# Altium project Baseboard-v2.0.PrjPcb (part 2 of 6)

## Sheet Power_Sheet.SchDoc
size A4; SheetNumber: 3; SheetTotal: 8
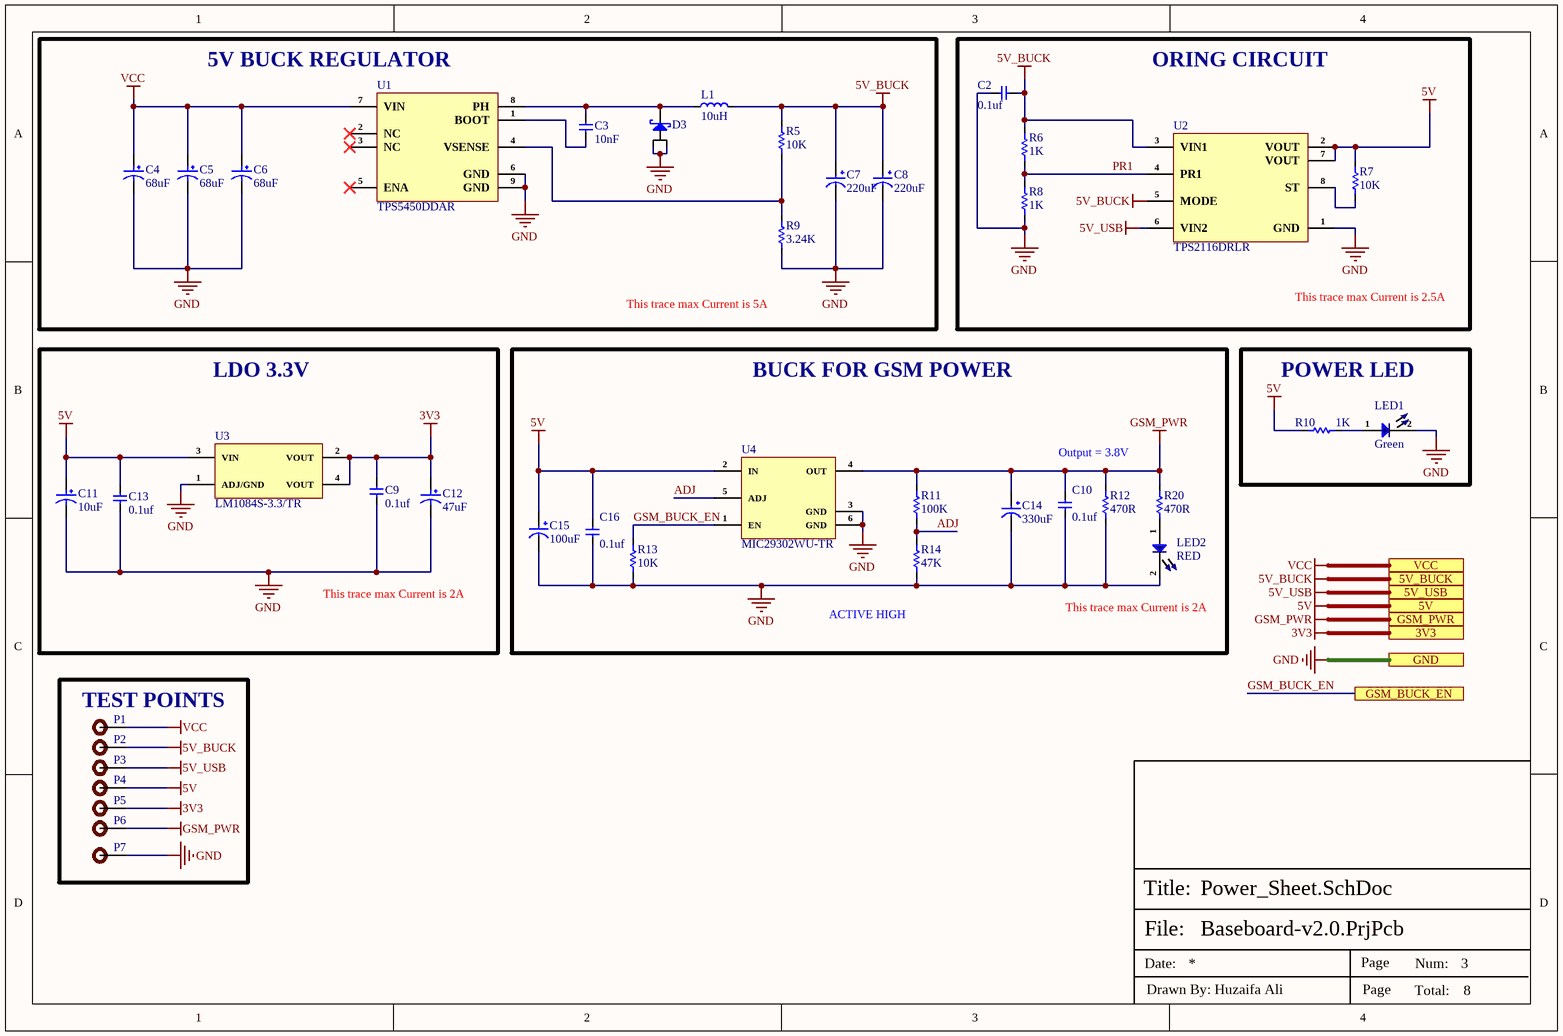
[diagram p2: Power_Sheet.SchDoc]

### Parts
C2  0.1uf  [Cap-0402]
C3  10nF  [Cap-0402]
C4  68uF  [RVT1H680M0607]
C5  68uF  [RVT1H680M0607]
C6  68uF  [RVT1H680M0607]
C7  220uF  [Case-D]
C8  220uF  [Case-D]
C9  0.1uf  [Cap-0402]
C10  0.1uf  [Cap-0402]
C11  10uF  [Case-A]
C12  47uF  [Case-A]
C13  0.1uf  [Cap-0402]
C14  330uF  [Case-E]
C15  100uF  [Case-B]
C16  0.1uf  [Cap-0402]
D3  ST20100L  [TO-277]  (value not drawn)
L1  10uH  [PSPMAA1040-100M-ANP]
LED1  Green  [LED-0402]
LED2  RED  [LED-0603]
P1  TEST POINT  [Test-point]  (value not drawn)
P2  TEST POINT  [Test-point]  (value not drawn)
P3  TEST POINT  [Test-point]  (value not drawn)
P4  TEST POINT  [Test-point]  (value not drawn)
P5  TEST POINT  [Test-point]  (value not drawn)
P6  TEST POINT  [Test-point]  (value not drawn)
P7  TEST POINT  [Test-point]  (value not drawn)
R5  10K  [Res-0201]
R6  1K  [Res-0201]
R7  10K  [Res-0201]
R8  1K  [Res-0201]
R9  3.24K  [Res-0603]
R10  1K  [Res-0201]
R11  100K  [Res-0201]
R12  470R  [Res-0201]
R13  10K  [Res-0201]
R14  47K  [Res-0402]
R20  470R  [Res-0201]
U1  TPS5450DDAR  [8-SO-EP_]
U2  TPS2116DRLR  [SOT-583]
U3  LM1084S-3.3/TR  [TO263-3_]
U4  MIC29302WU-TR  [TO-263-5 (D2PAK)]

### Blocks framed on the sheet
5V BUCK REGULATOR: C3-C8 D3 L1 R5 R9 U1
ORING CIRCUIT: C2 R6-R8 U2
LDO 3.3V: C9 C11-C13 U3
BUCK FOR GSM POWER: C10 C14-C16 LED2 R11-R14 R20 U4
POWER LED: LED1 R10
TEST POINTS: P1-P7

### Ports
3V3, 5V, 5V_BUCK, 5V_USB, GND, GSM_BUCK_EN, GSM_PWR, VCC

### Nets
3V3: C9.2 C12.1 P5.1 U3.2(VOUT) U3.4(VOUT) ; port 3V3
5V: C11.1 C13.2 C15.1 C16.2 P4.1 R7.1 R10.2 U2.2(VOUT) U2.7(VOUT) U3.3(VIN) U4.2(IN) ; port 5V
5V_BUCK: C2.2 C7.1 C8.1 L1.2 P2.1 R5.2 R6.2 U2.3(VIN1) U2.5(MODE) ; port 5V_BUCK
5V_USB: P3.1 U2.6(VIN2) ; port 5V_USB
GND: C2.1 C4.2 C5.2 C6.2 C7.2 C8.2 C9.1 C10.1 C11.2 C12.2 C13.1 C14.2 C15.2 C16.1 D3.1(A1) D3.3(A2) LED1.2 LED2.2 P7.1 R8.1 R9.1 R12.1 R13.1 R14.1 U1.6(GND) U1.9(GND) U2.1(GND) U3.1(ADJ/GND) U4.3(GND) U4.6(GND) ; port GND
GSM_PWR: C10.2 C14.1 P6.1 R11.2 R12.2 R20.2 U4.4(OUT) ; port GSM_PWR
VCC: C4.1 C5.1 C6.1 P1.1 U1.7(VIN) ; port VCC
ADJ: R11.1 R14.2 U4.5(ADJ)
GSM_BUCK_EN: R13.2 U4.1(EN) ; port GSM_BUCK_EN
PR1: R6.1 R8.2 U2.4(PR1)
NetC3_1: C3.1 U1.1(BOOT)
NetC3_2: C3.2 D3.2(K) L1.1 U1.8(PH)
NetLED1_1: LED1.1 R10.1
NetLED2_1: LED2.1 R20.1
NetR5_1: R5.1 R9.2 U1.4(VSENSE)
NetR7_2: R7.2 U2.8(ST)

Not connected (* = marked no-connect by the designer): U1 2(NC)* 3(NC)* 5(ENA)*

### Notes on the sheet
- (near R9) This trace max Current is 5A
- This trace max Current is 2.5A
- Output = 3.8V
- This trace max Current is 2A
- (near R14) ACTIVE HIGH
- (near LED2) This trace max Current is 2A
- File:
- Title:
- Date:
- Page
- Num:
- Total:
- Drawn By: Huzaifa Ali

### Library data of the parts
C2 C9 C10 C13 C16 = GRM155R62A104KE14D: CAP CER 0.1UF 100V X5R 0402; Manufacturer: Murata; Capacitance: 100nF; Tolerance: 10%; Item Type: Capacitor; Supplier 1: Arrow Electronics; Manufacturer Part Number: GRM155R62A104KE14D; RoHS: Yes; Category: Ceramic Capacitors; Stock 1: 870000; Pricing 1: 10000=0.00500, 20000=0.00410, 30000=0.00390, 50000=0.00370, 100000=0.00300 (USD); Mount: Surface Mount; Case/Package: 0402; Case Code (Metric): 1005; Case Code (Imperial): 0402; Weight: 0.000212oz; Min Operating Temperature: -55°C; Max Operating Temperature: 85°C; Packaging: Tape and Reel; Voltage Rating: 100V; Dielectric: X5R; Termination: SMD/SMT; Voltage Rating (DC): 100V; Package Quantity: 10000; Series: GRM; Length: 0.039inch; Width: 0.02inch; Height: 0.5mm; Thickness: 0.022inch; Reach SVHC Compliant: Yes; Lead Free: Lead Free; RoHS Compliant: Yes; ComponentLink1URL: http://www.farnell.com/datasheets/2079151.pdf?src-supplier=Farnell; ComponentLink1Description: http://www.farnell.com/datasheets/2079151.pdf?src-supplier=Farnell; ComponentLink2URL: http://www.mouser.com/ds/2/281/c02e-2905.pdf?src-supplier=Mouser; ComponentLink2Description: http://www.mouser.com/ds/2/281/c02e-2905.pdf?src-supplier=Mouser; ComponentLink3URL: http://www.farnell.com/datasheets/2079151.pdf?src-supplier=Element14; ComponentLink3Description: http://www.farnell.com/datasheets/2079151.pdf?src-supplier=Element14; ComponentLink4URL: http://search.murata.co.jp/Ceramy/image/img/A01X/G101/ENG/GRM155R62A104KE14-01.pdf?src-supplier=Digi-Key; ComponentLink4Description: http://search.murata.co.jp/Ceramy/image/img/A01X/G101/ENG/GRM155R62A104KE14-01.pdf?src-supplier=Digi-Key; ComponentLink5URL: http://www.farnell.com/datasheets/2079151.pdf?src-supplier=Newark; ComponentLink5Description: http://www.farnell.com/datasheets/2079151.pdf?src-supplier=Newark; Supplier Part Number 1: GRM155R62A104KE14D; LCSC Part Number: C162178
C3 = CC0402KRX7R9BB103: CAP CER 10000PF 50V X7R 0402; Manufacturer: Yageo; Tolerance: 10%; Item Type: Capacitor; Supplier 1: Avnet; Manufacturer Part Number: CC0402KRX7R9BB103; RoHS: Yes; Category: Ceramic Capacitors; Stock 1: 995000; Pricing 1: 10000=0.00178 (USD); Mount: Surface Mount; Case/Package: 0402; Case Code (Imperial): 0402; Case Code (Metric): 1005; Min Operating Temperature: -55°C; Max Operating Temperature: 125°C; Capacitance: 10nF; Dielectric: X7R; Packaging: Tape and Reel; Voltage Rating: 50V; Voltage Rating (DC): 50V; Package Quantity: 1; Termination: SMD/SMT; Resistor Type: Ceramic; Voltage: 50V; Series: CC; Length: 1mm; Width: 0.02inch; Height: 0.5mm; Thickness: 0.022inch; Depth: 0.5mm; Radiation Hardening: No; RoHS Compliant: Yes; Reach SVHC Compliant: Yes; Lead Free: Lead Free; Halogen Free: Halogen Free; ComponentLink1URL: https://datasheet.ciiva.com/11788/0900766b8079c870-11788375.pdf?src-supplier=RSComponents; ComponentLink1Description: https://datasheet.ciiva.com/11788/0900766b8079c870-11788375.pdf?src-supplier=RSComponents; ComponentLink2URL: https://datasheet.ciiva.com/26862/getdatasheetpartid-138248-26862642.pdf?src-supplier=Verical; ComponentLink2Description: https://datasheet.ciiva.com/26862/getdatasheetpartid-138248-26862642.pdf?src-supplier=Verical; ComponentLink3URL: https://datasheet.ciiva.com/7978/1489800-7978093.pdf?src-supplier=Element14; ComponentLink3Description: https://datasheet.ciiva.com/7978/1489800-7978093.pdf?src-supplier=Element14; ComponentLink4URL: https://datasheet.ciiva.com/28450/1489800-28450377.pdf?src-supplier=Element14; ComponentLink4Description: https://datasheet.ciiva.com/28450/1489800-28450377.pdf?src-supplier=Element14; ComponentLink5URL: https://datasheet.ciiva.com/176/mlccorderingcode-176349.pdf?src-supplier=Digi-Key; ComponentLink5Description: https://datasheet.ciiva.com/176/mlccorderingcode-176349.pdf?src-supplier=Digi-Key; ComponentLink6URL: https://datasheet.ciiva.com/176/mlccorderingcode-176348.pdf?src-supplier=Digi-Key; ComponentLink6Description: https://datasheet.ciiva.com/176/mlccorderingcode-176348.pdf?src-supplier=Digi-Key; ComponentLink7URL: https://datasheet.ciiva.com/176/mlccorderingcode-176350.pdf?src-supplier=Digi-Key; ComponentLink7Description: https://datasheet.ciiva.com/176/mlccorderingcode-176350.pdf?src-supplier=Digi-Key; Supplier Part Number 1: CC0402KRX7R9BB103; LCSC Part Number: C60133
C4-C6 = RVT1H680M0607: 68uF 50V SMD,D6.3xL7.7mm Aluminum Electrolytic Capacitors - SMD ROHS; Manufacturer: ROQANG; Manufacturer Part Number: RVT1H680M0607; Package: SMD,D6.3xL7.7mm; LCSC Part Number: C5221836; Item Type: Capacitor; ComponentLink1Description: LCSC; ComponentLink1URL: https://www.lcsc.com/product-detail/Aluminum-Electrolytic-Capacitors-SMD_ROQANG-RVT1H680M0607_C5221836.html
C7 C8 = TAJD227K010RNJ: CAP TANT 220UF 10% 10V 2917; Manufacturer: Kyocera AVX; Item Type: Capacitor; Supplier: Rs; Supplier Part Number: 1349925; Manufacturer Part Number: TAJD227K010RNJ; RoHS: Yes; Category: Tantalum Capacitors; Stock: 100; Pricing: 500=0.553, 2500=0.537, 5000=0.523 (GBP); ComponentLink1URL: https://datasheet.ciiva.com/11793/0900766b80ccdc61-11793083.pdf?src-supplier=Rs; ComponentLink1Description: https://datasheet.ciiva.com/11793/0900766b80ccdc61-11793083.pdf?src-supplier=Rs; ComponentLink2URL: https://datasheet.ciiva.com/3004/taj-3004530.pdf?src-supplier=Avnet; ComponentLink2Description: https://datasheet.ciiva.com/3004/taj-3004530.pdf?src-supplier=Avnet; ComponentLink3URL: https://datasheet.ciiva.com/3004/taj-3004531.pdf?src-supplier=Avnet; ComponentLink3Description: https://datasheet.ciiva.com/3004/taj-3004531.pdf?src-supplier=Avnet; ComponentLink4URL: https://datasheet.ciiva.com/264/taj-264391.pdf?src-supplier=Digi-Key; ComponentLink4Description: https://datasheet.ciiva.com/264/taj-264391.pdf?src-supplier=Digi-Key; ComponentLink5URL: https://datasheet.ciiva.com/264/taj-264392.pdf?src-supplier=Digi-Key; ComponentLink5Description: https://datasheet.ciiva.com/264/taj-264392.pdf?src-supplier=Digi-Key; ComponentLink6URL: https://datasheet.ciiva.com/264/taj-264393.pdf?src-supplier=Digi-Key; ComponentLink6Description: https://datasheet.ciiva.com/264/taj-264393.pdf?src-supplier=Digi-Key; ComponentLink7URL: https://datasheet.ciiva.com/15163/getdatasheetpartid-121064-15163429.pdf?src-supplier=Verical; ComponentLink7Description: https://datasheet.ciiva.com/15163/getdatasheetpartid-121064-15163429.pdf?src-supplier=Verical; ComponentLink8URL: https://datasheet.ciiva.com/16201/taj-16201535.pdf?src-supplier=Future+Electronics; ComponentLink8Description: https://datasheet.ciiva.com/16201/taj-16201535.pdf?src-supplier=Future+Electronics; LCSC Part Number: C8024
C11 = CA45-A-10V-10uF-K: 10uF 10V 8Ω@100kHz ±10% CASE-A-3216 Tantalum Capacitors ROHS; Manufacturer: CEC(Shenzhen Zhenhua XinYun Elec); Manufacturer Part Number: CA45-A-10V-10uF-K; Package: CASE-A-3216; LCSC Part Number: C128253; Item Type: Capacitor; ComponentLink1Description: LCSC; ComponentLink1URL: https://www.lcsc.com/product-detail/Tantalum-Capacitors_CEC-Shenzhen-Zhenhua-XinYun-Elec-CA45-A-10V-10uF-K_C128253.html
C12 = CA45-A-6.3V-47uF-K: 47uF 6.3V 5Ω@100kHz ±10% CASE-A-3216 Tantalum Capacitors ROHS; Manufacturer: CEC; Manufacturer Part Number: CA45-A-6.3V-47uF-K; Package: CASE-A-3216; ComponentLink1Description: LCSC; ComponentLink1URL: https://www.lcsc.com/product-detail/Tantalum-Capacitors_CEC-Shenzhen-Zhenhua-XinYun-Elec-CA45-A-6-3V-47uF-K_C129570.html; LCSC Part Number: C129570; Item Type: Capacitor
C14 = TAJE337M016RNJ: CAP TANT 330UF 20% 16V 2917; Manufacturer: Kyocera AVX; ESR (Equivalent Series Resistance): 400mR; Leakage Current: 52.8uA; Dissipation Factor: 30%; Item Type: Capacitor; Supplier 1: Arrow Electronics; Manufacturer Part Number: TAJE337M016RNJ; RoHS: Yes; Category: Tantalum Capacitors; Stock 1: 4000; Pricing 1: 400=1.8678, 2000=1.7998, 4000=1.7657, 6000=1.7481, 10000=1.7306, 30000=1.7133, 50000=1.6961 (USD); Mounting Technology: Surface Mount; Case/Package: 2917; Case Code (Imperial): 2917; Case Code (Metric): 7343; Min Operating Temperature: -55°C; Max Operating Temperature: 125°C; Voltage Rating: 16V; Tolerance: 20%; Packaging: Tape and Reel; Value: 330uF; Termination: SMD/SMT; Voltage Rating (DC): 16V; Series: TAJ; Features: General Purpose; Length: 7.3mm; Width: 4.3mm; Height: 4.3mm; Lead Free: Lead Free; RoHS Compliant: Yes; ComponentLink1URL: https://datasheet.ciiva.com/12882/taj-27497-12882412.pdf?src-supplier=Mouser; ComponentLink1Description: https://datasheet.ciiva.com/12882/taj-27497-12882412.pdf?src-supplier=Mouser; Supplier Part Number 1: TAJE337M016RNJ; LCSC Part Number: C51599
C15 = TAJB107M010RNJ: CAP TANT 100UF 20% 10V 1411; Manufacturer: Kyocera AVX; Dielectric Material: Tantalum; Tolerance: 10%; ESR (Equivalent Series Resistance): 1.4R; Leakage Current: 10uA; Dissipation Factor: 8%; Item Type: Capacitor; Supplier 1: Rs; Manufacturer Part Number: TAJB107M010RNJ; RoHS: Yes; Category: Tantalum Capacitors; Stock 1: 17520; Pricing 1: 2000=0.302 (GBP); Mounting Technology: Surface Mount; Case/Package: 1210; Case Code (Imperial): 1210; Case Code (Metric): 3528; Min Operating Temperature: -55°C; Max Operating Temperature: 125°C; Value: 100uF; Voltage Rating (DC): 10V; Series: TAJ; Construction: Flat; Voltage Rating: 10V; Package Quantity: 2000; Packaging: Tape and Reel; Termination: SMD/SMT; Voltage: 10V; Features: General Purpose; Length: 3.5mm; Width: 2.8mm; Height: 2.1mm; Depth: 2.8mm; Radiation Hardening: No; Lead Free: Lead Free; RoHS Compliant: Yes; Reach SVHC Compliant: No; ComponentLink1URL: https://datasheet.ciiva.com/264/taj-264281.pdf?src-supplier=Digi-Key; ComponentLink1Description: https://datasheet.ciiva.com/264/taj-264281.pdf?src-supplier=Digi-Key; ComponentLink2URL: https://datasheet.ciiva.com/264/taj-264280.pdf?src-supplier=Digi-Key; ComponentLink2Description: https://datasheet.ciiva.com/264/taj-264280.pdf?src-supplier=Digi-Key; ComponentLink3URL: https://datasheet.ciiva.com/264/taj-264282.pdf?src-supplier=Digi-Key; ComponentLink3Description: https://datasheet.ciiva.com/264/taj-264282.pdf?src-supplier=Digi-Key; ComponentLink4URL: https://datasheet.ciiva.com/11225/taj-11225964.pdf?src-supplier=Avnet; ComponentLink4Description: https://datasheet.ciiva.com/11225/taj-11225964.pdf?src-supplier=Avnet; ComponentLink5URL: https://datasheet.ciiva.com/11225/taj-11225963.pdf?src-supplier=Avnet; ComponentLink5Description: https://datasheet.ciiva.com/11225/taj-11225963.pdf?src-supplier=Avnet; Supplier Part Number 1: 1354069; LCSC Part Number: C7196
D3 = ST20100L: 100V Single 650mV@20A 20A TO-277 Schottky Barrier Diodes (SBD) ROHS; Manufacturer: Jiangsu Changjing Electronics Technology Co., Ltd.; Item Type: Diode; Manufacturer Part Number: ST20100L; Package: TO-277; LCSC Part Number: C2693410; ComponentLink1Description: LCSC; ComponentLink1URL: https://www.lcsc.com/product-detail/Schottky-Barrier-Diodes-SBD_Jiangsu-Changjing-Electronics-Technology-Co-Ltd-ST20100L_C2693410.html
L1 = PSPMAA1040-100M-ANP: 7A 10uH ±20% 10A SMD,10.3x10.5mm Power Inductors ROHS; Manufacturer: PROD Tech; Manufacturer Part Number: PSPMAA1040-100M-ANP; Package: SMD,10.3x10.5mm; LCSC Part Number: C2983105; Item Type: Inductor; ComponentLink1Description: LCSC; ComponentLink1URL: https://www.lcsc.com/product-detail/Power-Inductors_PROD-Tech-PSPMAA1040-100M-ANP_C2983105.html
LED1 = 16-213/GHC-YR1S1/3T: Green 520~535nm 0402 Light Emitting Diodes (LED) RoHS; Manufacturer: Everlight Elec; Luminous Intensity (IF=20mA): 112~285mcd; Package: 0402; Illumination Color: Green; Dominant Wavelength / Coordinate rank: 520~535nm; Mounting Type: Surface Mount; Manufacturer Part Number: 16-213/GHC-YR1S1/3T; ComponentLink1Description: LCSC; ComponentLink1URL: https://www.lcsc.com/product-detail/Light-Emitting-Diodes-LED_Everlight-Elec-16-213-GHC-YR1S1-3T_C74338.html; LCSC Part Number: C74338; Item Type: LED
LED2 = 19-21/R7C-AK1L2BY/3T: Red 632nm LED Indication - Discrete 2.05V 0603 (1608 Metric); Manufacturer: Everlight Elec; Manufacturer Part Number: 19-21/R7C-AK1L2BY/3T; Package: 0603; LCSC Part Number: C1322287; Item Type: LED; ComponentLink1Description: LCSC; ComponentLink1URL: https://www.lcsc.com/product-detail/Light-Emitting-Diodes-LED_Everlight-Elec-19-21-R7C-AK1L2BY-3T_C1322287.html
P1-P7 = TEST POINT: Test Point ON
R5 R7 R13 = RC0201FR-0710KL: RES SMD 10K OHM 1% 1/20W 0201; Manufacturer: Yageo; Item Type: Resistor; Manufacturer Part Number: RC0201FR-0710KL; Package: 0201; ComponentLink7Description: LCSC; ComponentLink7URL: https://www.lcsc.com/product-detail/Chip-Resistor-Surface-Mount_YAGEO-RC0201FR-0710KL_C106225.html; LCSC Part Number: C106225
R6 R8 R10 = RC0201FR-071KP: RES 1K OHM 1% 1/20W 0201; Manufacturer: Yageo; Supplier 1: Digi-Key; Manufacturer Part Number: RC0201FR-071KP; RoHS: Yes; Stock 1: 4800; Pricing 1: 1=0.11000, 10=0.10200, 100=0.03940, 1000=0.01734, 2500=0.01497, 5000=0.01340 (USD); RoHS Compliant: Yes; Supplier Part Number 1: 13-RC0201FR-071KPCT-ND; LCSC Part Number: C3953443
R9 = 0603WAF3241T5E: 100mW Thick Film Resistors ±1% 3.24kΩ 0603 Chip Resistor - Surface Mount ROHS; Manufacturer: UNI-ROYAL; Manufacturer Part Number: 0603WAF3241T5E; Package: 0603; LCSC Part Number: C22994; Item Type: Resistor; ComponentLink1Description: LCSC; ComponentLink1URL: https://www.lcsc.com/product-detail/Chip-Resistor-Surface-Mount_UNI-ROYAL-Uniroyal-Elec-0603WAF3241T5E_C22994.html
R11 = RC0201JR-07100KL: RES SMD 100K OHM 5% 1/20W 0201; Manufacturer: Yageo; Resistance: 100kR; Temperature Coefficient: 200ppm/°C; Power Rating: 50mW; Voltage Rating: 25V; Supplier 1: Arrow Electronics; Manufacturer Part Number: RC0201JR-07100KL; RoHS: Yes; Category: Chip SMD Resistors; Stock 1: 76; Pricing 1: 1=0.09240, 10=0.09140, 25=0.05450, 10000=0.00340, 100000=0.00320, 1000000=0.00180, 5000000=0.00110 (USD); Case/Package: 0201; Contact Plating: Tin,Matte; Case Code (Metric): 0603; Case Code (Imperial): 0201; Weight: 6E-06oz; Size Code: 0201; Min Operating Temperature: -55°C; Max Operating Temperature: 125°C; Tolerance: 5%; Resistor Type: Thick Film; Package Quantity: 1; Packaging: Tape and Reel; Number of Terminations: 2; Termination: SMD/SMT; Max Power Dissipation: 50mW; Voltage Rating (DC): 25V; Features: Moisture Resistant; Series: RC; Resistance Tolerance: 5%; Construction: Rectangular; Length: 0.6mm; Width: 0.012inch; Height: 0.01inch; Depth: 0.3mm; Radiation Hardening: No; REACH SVHC: No SVHC; Military Standard: Not; Lead Free: Lead Free; RoHS Compliant: Yes; ComponentLink1URL: https://datasheet.ciiva.com/2462/pyu-r-int-thick-7-2462817.pdf?src-supplier=Digi-Key; ComponentLink1Description: https://datasheet.ciiva.com/2462/pyu-r-int-thick-7-2462817.pdf?src-supplier=Digi-Key; ComponentLink2URL: https://datasheet.ciiva.com/2462/pyu-r-int-thick-7-2462818.pdf?src-supplier=Digi-Key; ComponentLink2Description: https://datasheet.ciiva.com/2462/pyu-r-int-thick-7-2462818.pdf?src-supplier=Digi-Key; ComponentLink3URL: https://datasheet.ciiva.com/2462/pyu-r-int-thick-7-2462819.pdf?src-supplier=Digi-Key; ComponentLink3Description: https://datasheet.ciiva.com/2462/pyu-r-int-thick-7-2462819.pdf?src-supplier=Digi-Key; ComponentLink4URL: https://datasheet.ciiva.com/8888/pyu-rc0201-51-rohs-l-8-8888005.pdf?src-supplier=Avnet; ComponentLink4Description: https://datasheet.ciiva.com/8888/pyu-rc0201-51-rohs-l-8-8888005.pdf?src-supplier=Avnet; ComponentLink5URL: https://datasheet.ciiva.com/8896/pyu-rc0201-51-rohs-l-8-8896213.pdf?src-supplier=Avnet; ComponentLink5Description: https://datasheet.ciiva.com/8896/pyu-rc0201-51-rohs-l-8-8896213.pdf?src-supplier=Avnet; ComponentLink6URL: https://datasheet.ciiva.com/28395/pyu-rc0201-51-rohs-l-8-28395542.pdf?src-supplier=Avnet+Europe; ComponentLink6Description: https://datasheet.ciiva.com/28395/pyu-rc0201-51-rohs-l-8-28395542.pdf?src-supplier=Avnet+Europe; ComponentLink7URL: https://datasheet.ciiva.com/28639/1421516-28639863.pdf?src-supplier=Element14; ComponentLink7Description: https://datasheet.ciiva.com/28639/1421516-28639863.pdf?src-supplier=Element14; ComponentLink8URL: https://datasheet.ciiva.com/7672/1563626-7672249.pdf?src-supplier=Element14; ComponentLink8Description: https://datasheet.ciiva.com/7672/1563626-7672249.pdf?src-supplier=Element14; ComponentLink9URL: https://datasheet.ciiva.com/7672/1563626-7672250.pdf?src-supplier=Element14; ComponentLink9Description: https://datasheet.ciiva.com/7672/1563626-7672250.pdf?src-supplier=Element14; Supplier Part Number 1: RC0201JR-07100KL; LCSC Part Number: C106230
R12 R20 = RC0201JR-07470RL: RES 470 OHM 5% 1/20W 0201; Manufacturer: Yageo; Temperature Coefficient: 200ppm/°C; Voltage Rating (DC): 25V; Max Power Dissipation: 50mW; Supplier 1: Digi-Key; Manufacturer Part Number: RC0201JR-07470RL; RoHS: Yes; Category: Chip SMD Resistors; Stock 1: 173754; Pricing 1: 1=0.10000, 10=0.02600, 100=0.01040, 1000=0.00466, 2500=0.00405, 5000=0.00334 (USD); Case/Package: 0201; Number of Pins: 2; Contact Plating: Tin,Matte; Case Code (Metric): 0603; Case Code (Imperial): 0201; Min Operating Temperature: -55°C; Max Operating Temperature: 125°C; Resistor Type: Thick Film; Tolerance: 5%; Resistance: 470R; Number of Terminations: 2; Termination: SMD/SMT; Features: Moisture Resistant; Power Rating: 50mW; Voltage Rating: 25V; Package Quantity: 1; Packaging: Tape and Reel; Length: 0.6mm; Width: 0.3mm; Height: 0.01inch; Depth: 0.3mm; Radiation Hardening: No; Military Standard: Not; Lead Free: Lead Free; REACH SVHC: No SVHC; ComponentLink1URL: https://datasheet.ciiva.com/5924/443682-5924928.pdf?src-supplier=Farnell; ComponentLink1Description: https://datasheet.ciiva.com/5924/443682-5924928.pdf?src-supplier=Farnell; ComponentLink2URL: https://datasheet.ciiva.com/8885/pyu-rc0201-51-rohs-l-8-8885600.pdf?src-supplier=Avnet; ComponentLink2Description: https://datasheet.ciiva.com/8885/pyu-rc0201-51-rohs-l-8-8885600.pdf?src-supplier=Avnet; ComponentLink3URL: https://datasheet.ciiva.com/28390/pyu-rc0201-51-rohs-l-8-28390376.pdf?src-supplier=Avnet+Europe; ComponentLink3Description: https://datasheet.ciiva.com/28390/pyu-rc0201-51-rohs-l-8-28390376.pdf?src-supplier=Avnet+Europe; ComponentLink4URL: https://datasheet.ciiva.com/8885/pyu-rc0201-51-rohs-l-8-8885642.pdf?src-supplier=Avnet; ComponentLink4Description: https://datasheet.ciiva.com/8885/pyu-rc0201-51-rohs-l-8-8885642.pdf?src-supplier=Avnet; ComponentLink5URL: https://datasheet.ciiva.com/2462/pyu-r-int-thick-7-2462802.pdf?src-supplier=Digi-Key; ComponentLink5Description: https://datasheet.ciiva.com/2462/pyu-r-int-thick-7-2462802.pdf?src-supplier=Digi-Key; ComponentLink6URL: https://datasheet.ciiva.com/2462/pyu-r-int-thick-7-2462803.pdf?src-supplier=Digi-Key; ComponentLink6Description: https://datasheet.ciiva.com/2462/pyu-r-int-thick-7-2462803.pdf?src-supplier=Digi-Key; ComponentLink7URL: https://datasheet.ciiva.com/2462/pyu-r-int-thick-7-2462804.pdf?src-supplier=Digi-Key; ComponentLink7Description: https://datasheet.ciiva.com/2462/pyu-r-int-thick-7-2462804.pdf?src-supplier=Digi-Key; Supplier Part Number 1: 311-470NCT-ND; LCSC Part Number: C163491
R14 = RC0402FR-0747KL: RES 47K OHM 1% 1/16W 0402; Manufacturer: Yageo; Power Rating: 62.5mW; Temperature Coefficient: 100ppm/°C; Voltage Rating: 50V; Resistance: 47kR; Max Power Dissipation: 63mW; Item Type: Resistor; Supplier 1: Avnet; Manufacturer Part Number: RC0402FR-0747KL; RoHS: Yes; Category: Chip SMD Resistors; Stock 1: 680000; Pricing 1: 10000=0.00085, 20000=0.00087, 40000=0.00084, 60000=0.00083, 80000=0.00079, 100000=0.00078, 1000000=0.00076 (USD); Case/Package: 0402; Case Code (Imperial): 0402; Case Code (Metric): 1005; Size Code: 0402; Min Operating Temperature: -55°C; Max Operating Temperature: 155°C; Tolerance: 1%; Series: RC; Packaging: Tape and Reel; Package Quantity: 1; Termination: SMD/SMT; Resistor Type: Thick Film; Number of Terminations: 2; Features: Moisture Resistant; Resistance Tolerance: 1%; Construction: Rectangular; Length: 1mm; Width: 0.02inch; Height: 0.016inch; Depth: 0.5mm; RoHS Compliant: Yes; Military Standard: Not; Lead Free: Lead Free; ComponentLink1URL: https://datasheet.ciiva.com/46412/1018594-46412839.pdf?src-supplier=Element14; ComponentLink1Description: https://datasheet.ciiva.com/46412/1018594-46412839.pdf?src-supplier=Element14; ComponentLink2URL: https://datasheet.ciiva.com/2453/pyu-r-int-thick-7-2453389.pdf?src-supplier=Digi-Key; ComponentLink2Description: https://datasheet.ciiva.com/2453/pyu-r-int-thick-7-2453389.pdf?src-supplier=Digi-Key; ComponentLink3URL: https://datasheet.ciiva.com/2453/pyu-r-int-thick-7-2453390.pdf?src-supplier=Digi-Key; ComponentLink3Description: https://datasheet.ciiva.com/2453/pyu-r-int-thick-7-2453390.pdf?src-supplier=Digi-Key; ComponentLink4URL: https://datasheet.ciiva.com/2453/pyu-r-int-thick-7-2453388.pdf?src-supplier=Digi-Key; ComponentLink4Description: https://datasheet.ciiva.com/2453/pyu-r-int-thick-7-2453388.pdf?src-supplier=Digi-Key; ComponentLink5URL: https://datasheet.ciiva.com/15189/getdatasheetpartid-323748-15189466.pdf?src-supplier=Verical; ComponentLink5Description: https://datasheet.ciiva.com/15189/getdatasheetpartid-323748-15189466.pdf?src-supplier=Verical; ComponentLink6URL: https://datasheet.ciiva.com/16793/pyu-rc0402-51-rohs-l-6-r-16793430.pdf?src-supplier=Future+Electronics; ComponentLink6Description: https://datasheet.ciiva.com/16793/pyu-rc0402-51-rohs-l-6-r-16793430.pdf?src-supplier=Future+Electronics; Supplier Part Number 1: RC0402FR-0747KL; LCSC Part Number: C93943
U1 = TPS5450DDAR: IC REG BUCK ADJUSTABLE 5A 8SOPWR; Manufacturer: Texas Instruments; Min Input Voltage: 5.5V; Number of Outputs: 1; Output Voltage: 31V; Max Supply Voltage: 36V; Switching Frequency: 500kHz; Synchronous Rectifier: No; Quiescent Current: 3mA; Min Output Voltage: 1.22V; Efficiency: 90%; Supplier 1: Mouser; Manufacturer Part Number: TPS5450DDAR; RoHS: Yes; Category: Voltage Regulators - Switching; Stock 1: 10304; Pricing 1: 1=5.44, 10=4.88, 50=4.62, 100=4, 1000=2.9, 10000=2.8 (USD); Mounting Technology: Surface Mount; Case/Package: HSOP; Pins: 8; Weight: 0.00249oz; Min Operating Temperature: -40°C; Max Operating Temperature: 125°C; Packaging: Tape and Reel; Package Quantity: 1; Max Output current: 5A; Output Current: 5A; Max Output Voltage: 31V; Operating Supply Voltage: 36V; Output Type: Adjustable; Series: SWIFT™; Length: 5mm; Width: 4mm; Height: 1.55mm; Radiation Hardening: No; Lead Free: Lead Free; RoHS Compliant: Yes; ComponentLink1URL: https://datasheet.ciiva.com/15113/getdatasheetpartid-172659-15113657.pdf?src-supplier=Verical; ComponentLink1Description: https://datasheet.ciiva.com/15113/getdatasheetpartid-172659-15113657.pdf?src-supplier=Verical; ComponentLink2URL: https://datasheet.ciiva.com/2035/tps5450-2035367.pdf?src-supplier=Digi-Key; ComponentLink2Description: https://datasheet.ciiva.com/2035/tps5450-2035367.pdf?src-supplier=Digi-Key; ComponentLink3URL: https://datasheet.ciiva.com/2035/tps5450-2035366.pdf?src-supplier=Digi-Key; ComponentLink3Description: https://datasheet.ciiva.com/2035/tps5450-2035366.pdf?src-supplier=Digi-Key; ComponentLink4URL: https://datasheet.ciiva.com/2035/tps5450-2035368.pdf?src-supplier=Digi-Key; ComponentLink4Description: https://datasheet.ciiva.com/2035/tps5450-2035368.pdf?src-supplier=Digi-Key; ComponentLink5URL: https://datasheet.ciiva.com/14303/tps5450-14303689.pdf?src-supplier=Avnet; ComponentLink5Description: https://datasheet.ciiva.com/14303/tps5450-14303689.pdf?src-supplier=Avnet; ComponentLink6URL: https://datasheet.ciiva.com/3220/tps5450-3220230.pdf?src-supplier=Avnet; ComponentLink6Description: https://datasheet.ciiva.com/3220/tps5450-3220230.pdf?src-supplier=Avnet; Supplier Part Number 1: 595-TPS5450DDAR; LCSC Part Number: C114425; Item type: IC
U2 = TPS2116DRLR: 1.6-V TO 5.5-V, 40-M, 2.5-A, LOW; Manufacturer: Texas Instruments; Item Type: IC; Supplier 1: Mouser; Manufacturer Part Number: TPS2116DRLR; RoHS: Yes; Category: Voltage Supervisors; Stock 1: 27931; Pricing 1: 1=0.9, 10=0.814, 50=0.772, 100=0.634, 1000=0.414, 10000=0.363 (USD); Supplier Part Number 1: 595-TPS2116DRLR; LCSC Part Number: C3235557; ComponentLink1Description: LCSC; ComponentLink1URL: https://www.lcsc.com/product-detail/Power-Distribution-Switches_Texas-Instruments-TPS2116DRLR_C3235557.html
U3 = LM1084S-3.3/TR: 72dB@(120Hz) 5A Fixed 3.3V~3.3V Positive 12V TO-263-3 Linear Voltage Regulators (LDO) ROHS; Manufacturer: HGSEMI; Item Type: IC; Manufacturer Part Number: LM1084S-3.3/TR; Package: TO-263-3; LCSC Part Number: C259972; ComponentLink1Description: LCSC; ComponentLink1URL: https://www.lcsc.com/product-detail/Linear-Voltage-Regulators-LDO_HGSEMI-LM1084S-3-3-TR_C259972.html
U4 = MIC29302WU-TR: IC REG LDO ADJ 3A TO263-5; Manufacturer: Microchip; Output Voltage: 26V; Dropout Voltage: 370mV; Number of Regulators: 1; Min Input Voltage: 2.5V; Min Output Voltage: 1.25V; Max Output Voltage: 25V; Output Type: Adjustable; Output Configuration: Positive; Input Bias Current: 40nA; Reference Voltage: 1.24V; Quiescent Current: 35mA; Accuracy: 1%; Supplier 1: Future Electronics; Manufacturer Part Number: MIC29302WU-TR; RoHS: Yes; Category: Voltage Regulators - Linear; Pricing 1: 750=2.12000, 1500=2.09000, 2250=2.07000, 3000=2.06000, 3750=2.02000 (USD); Mount: Surface Mount; Case/Package: TO-263; Number of Pins: 5; Min Operating Temperature: -40°C; Max Operating Temperature: 125°C; Packaging: Tape and Reel; Package Quantity: 750; Series: -; Output Current: 3A; Max Input Voltage: 26V; Polarity: Positive; Number of Outputs: 1; Max Output Current: 3A; Length: 10.67mm; Width: 9.17mm; Height: 4.59mm; Radiation Hardening: No; Reach SVHC Compliant: Yes; RoHS Compliant: Yes; Lead Free: Lead Free; ComponentLink1URL: https://datasheet.ciiva.com/23772/1572633-23772885.pdf?src-supplier=Newark; ComponentLink1Description: https://datasheet.ciiva.com/23772/1572633-23772885.pdf?src-supplier=Newark; ComponentLink2URL: https://datasheet.ciiva.com/16296/mic29150-16296190.pdf?src-supplier=Future+Electronics; ComponentLink2Description: https://datasheet.ciiva.com/16296/mic29150-16296190.pdf?src-supplier=Future+Electronics; ComponentLink3URL: https://datasheet.ciiva.com/15200/getdatasheetpartid-143209-15200663.pdf?src-supplier=Verical; ComponentLink3Description: https://datasheet.ciiva.com/15200/getdatasheetpartid-143209-15200663.pdf?src-supplier=Verical; Supplier Part Number 1: 3153683; LCSC Part Number: C11149; Item Type: IC